# EAGLE design ECU full (EAGLE 9.6.2)
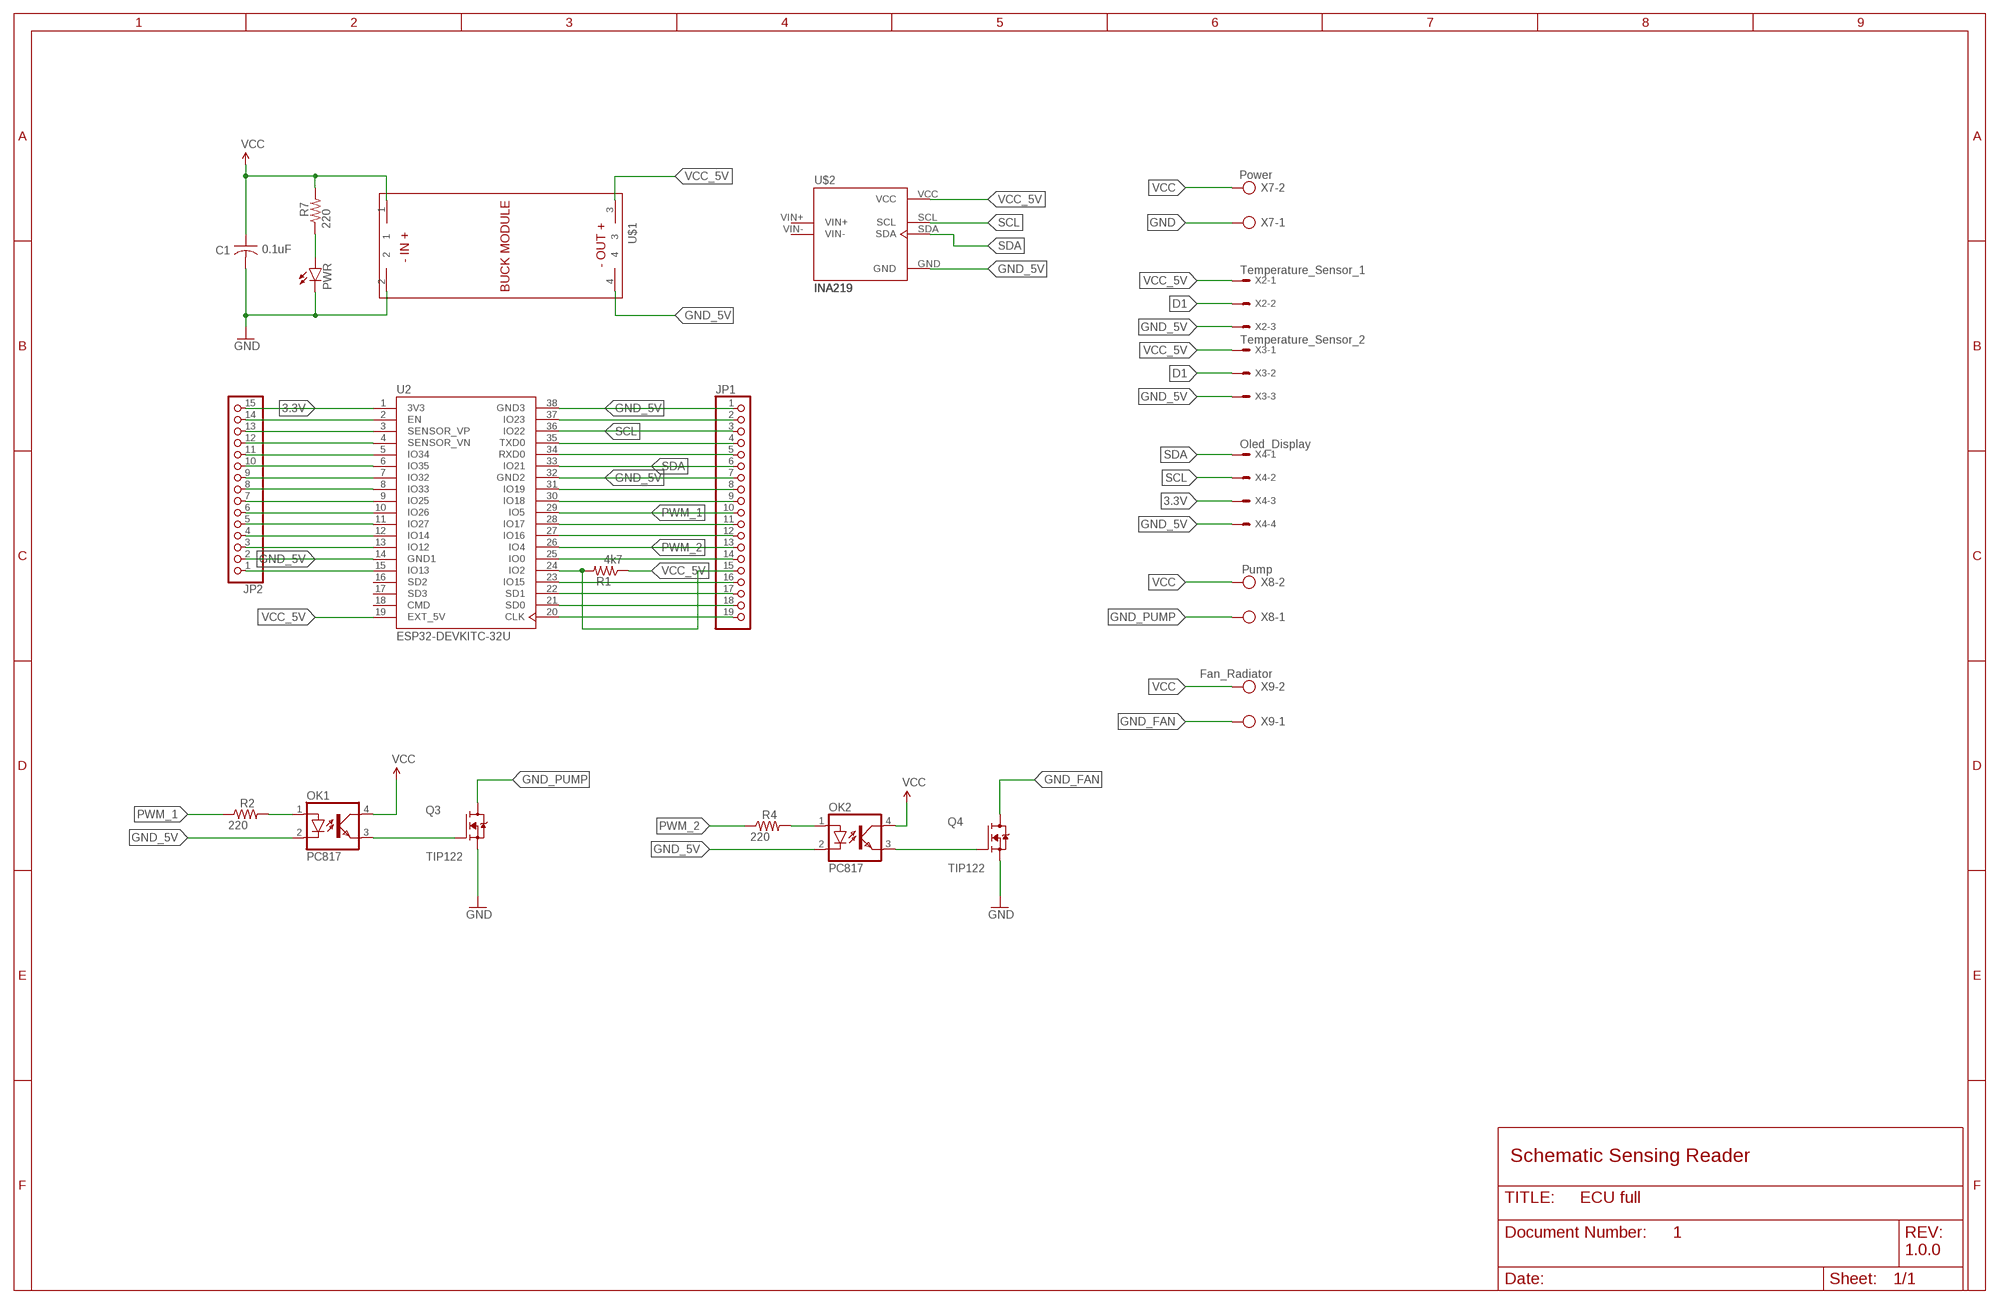
[diagram p0: schematic, sheet 1]
FRAME1 (FRAME_B_L): DESIGNER: PRATIK MAKWANA; DOC: 1; REV: 1.0.0

## Parts
C1  0.1uF  C-US050-030X075  [C050-030X075]
JP1  PINHD-1X19  [1X19]
JP2  PINHD-1X15  [1X15]
OK1  PC817  [DIL04]
OK2  PC817  [DIL04]
PWR  LED5MM  [LED5MM]
Q3  TIP122  IRF3205  [TO254P1041X444X2933-3]
Q4  TIP122  IRF3205  [TO254P1041X444X2933-3]
R1  4k7  R-US_0207/10  [0207/10]
R2  220  R-US_0207/10  [0207/10]
R4  220  R-US_0207/10  [0207/10]
R7  220  R-US_0207/10  [0207/10]
U2  ESP32-DEVKITC-32U  [MODULE_ESP32-DEVKITC-32U]
U$1  BUCK_MODULEWITH_SMDPADS&THROUGHHOLES  [BUCK_MODULE]
U$2  INA219  [INA219]
X2  Temperature_Sensor_1  22-23-2031  [22-23-2031]
X3  Temperature_Sensor_2  22-23-2031  [22-23-2031]
X4  Oled_Display  22-23-2041  [22-23-2041]
X7  Power  AK500/2  [AK500/2]
X8  Pump  AK500/2  [AK500/2]
X9  Fan_Radiator  AK500/2  [AK500/2]

## Nets
3.3V: JP2.15 U2.1(3V3) X4.3
D1: JP1.15 R1.2 U2.24(IO2) X2.2 X3.2
GND: C1.2 PWR.K(C) Q3.3(S) Q4.3(S) U$1.2 X7.1
GND_5V: JP1.1 JP1.7 JP2.2 OK1.2(C) OK2.2(C) U2.14(GND1) U2.32(GND2) U2.38(GND3) U$1.4 U$2.GND X2.3 X3.3 X4.4
GND_FAN: Q4.2(D) X9.1
GND_PUMP: Q3.2(D) X8.1
N$1: OK1.1(A) R2.2
N$2: JP2.14 U2.2(EN)
N$3: JP2.13 U2.3(SENSOR_VP)
N$4: JP2.12 U2.4(SENSOR_VN)
N$5: JP2.11 U2.5(IO34)
N$6: JP2.10 U2.6(IO35)
N$7: JP2.9 U2.7(IO32)
N$8: JP2.8 U2.8(IO33)
N$9: JP2.7 U2.9(IO25)
N$10: JP2.6 U2.10(IO26)
N$11: JP2.5 U2.11(IO27)
N$12: JP2.4 U2.12(IO14)
N$13: JP2.3 U2.13(IO12)
N$14: JP2.1 U2.15(IO13)
N$15: OK1.3(EMIT) Q3.1(G)
N$16: OK2.1(A) R4.2
N$17: OK2.3(EMIT) Q4.1(G)
N$18: JP1.19 U2.20(CLK)
N$19: JP1.18 U2.21(SD0)
N$20: JP1.17 U2.22(SD1)
N$21: JP1.14 U2.25(IO0)
N$22: JP1.16 U2.23(IO15)
N$23: JP1.12 U2.27(IO16)
N$24: JP1.11 U2.28(IO17)
N$25: JP1.9 U2.30(IO18)
N$26: JP1.2 U2.37(IO23)
N$27: JP1.4 U2.35(TXD0)
N$28: JP1.5 U2.34(RXD0)
N$29: JP1.8 U2.31(IO19)
N$30: PWR.A R7.1
PWM_1: JP1.10 R2.1 U2.29(IO5)
PWM_2: JP1.13 R4.1 U2.26(IO4)
SCL: JP1.3 U2.36(IO22) U$2.SCL X4.2
SDA: JP1.6 U2.33(IO21) U$2.SDA X4.1
VCC: C1.1 OK1.4(COL) OK2.4(COL) R7.2 U$1.1 X7.2 X8.2 X9.2
VCC_5V: R1.1 U2.19(EXT_5V) U$1.3 U$2.VCC X2.1 X3.1
Unconnected: U2.16(SD2) U2.17(SD3) U2.18(CMD) U$2.VIN+ U$2.VIN-

## Notes on the sheet
- Schematic Sensing Reader

## Library data of the parts
C1 = adafruit:C-US: CAPACITOR, American symbol
JP1 = pinhead:PINHD-1X19: PIN HEADER
JP2 = pinhead:PINHD-1X15: PIN HEADER
OK1 OK2 = optocoupler:PC817: SHARP OPTO COUPLER; MPN: PC817X4J000F; OC_FARNELL: 9707727; OC_NEWARK: 97K7059
PWR = led:LED: LED OSRAM: - CHIPLED LG R971, LG N971, LY N971, LG Q971, LY Q971, LO R971, LY R971 LH N974, LH R974 LS Q976, LO Q976, LY Q976 LO Q996 - Hyper CHIPLED LW Q18S LB Q993, LB Q99A, LB R99A - SideLED LS A670, LO A670, LY A670, LG A670, LP A670 LB A673, LV A673, LT A673, LW A673 LH A674 LY A675 LS A676, LA A676, LO A676, LY A676, LW A676 LS A679, LY A679, LG A679 - Hyper Micro SIDELED® LS Y876, LA Y876, LO Y876, LY Y876 LT Y87S - SmartLED LW L88C, LW L88S LB L89C, LB L89S, LG L890 LS L89K, LO L89K, LY L89K LS L896, LA L896, LO L896, LY L896 - TOPLED LS T670, LO T670, LY T670, LG T670, LP T670 LSG T670, LSP T670, LSY T670, LOP T670, LYG T670 LG T671, LOG T671, LSG T671 LB T673, LV T673, LT T673, LW T673 LH T674 LS T676, LA T676, LO T676, LY T676, LB T676, LH T676, LSB T676, LW T676 LB T67C, LV T67C, LT T67C, LS T67K, LO T67K, LY T67K, LW E67C LS E67B, LA E67B, LO E67B, LY E67B, LB E67C, LV E67C, LT E67C LW T67C LS T679, LY T679, LG T679 LS T770, LO T770, LY T770, LG T770, LP T770 LB T773, LV T773, LT T773, LW T773 LH T774 LS E675, LA E675, LY E675, LS T675 LS T776, LA T776, LO T776, LY T776, LB T776 LHGB T686 LT T68C, LB T68C - Hyper Mini TOPLED® LB M676 - Mini TOPLED Santana® LG M470 LS M47K, LO M47K, LY M47K Source: http://www.osram.convergy.de LUXEON: - LUMILED® LXK2-PW12-R00, LXK2-PW12-S00, LXK2-PW14-U00, LXK2-PW14-V00 LXK2-PM12-R00, LXK2-PM12-S00, LXK2-PM14-U00 LXK2-PE12-Q00, LXK2-PE12-R00, LXK2-PE12-S00, LXK2-PE14-T00, LXK2-PE14-U00 LXK2-PB12-K00, LXK2-PB12-L00, LXK2-PB12-M00, LXK2-PB14-N00, LXK2-PB14-P00, LXK2-PB14-Q00 LXK2-PR12-L00, LXK2-PR12-M00, LXK2-PR14-Q00, LXK2-PR14-R00 LXK2-PD12-Q00, LXK2-PD12-R00, LXK2-PD12-S00 LXK2-PH12-R00, LXK2-PH12-S00 LXK2-PL12-P00, LXK2-PL12-Q00, LXK2-PL12-R00 Source: www.luxeon.com KINGBRIGHT: KA-3528ASYC Source: www.kingbright.com
Q3 Q4 = IRF3205:IRF3205: N-Channel 55V 75A (Tc) 170W (Tc) Through Hole TO-220AB Check availability <https://pricing.snapeda.com/parts/IRF3205/Infineon%20Technologies/view-part?ref=eda>; AVAILABILITY: In Stock; CHECK_PRICES: https://www.snapeda.com/parts/IRF3205/Infineon/view-part/?ref=eda; DESCRIPTION: N-Channel 55V 110A (Tc) 200W (Tc) Through Hole TO-220AB; MF: Infineon Technologies; MP: IRF3205; PACKAGE: TO-220 Infineon; PRICE: None; SNAPEDA_LINK: https://www.snapeda.com/parts/IRF3205/Infineon/view-part/?ref=snap
R1 R2 R4 R7 = adafruit:R-US_: RESISTOR, American symbol
U2 = ESP32-DEVKITC-32U:ESP32-DEVKITC-32U: Check availability <https://pricing.snapeda.com/parts/ESP32-DEVKITC-32U/Espressif%20Systems/view-part?ref=eda>; AVAILABILITY: In Stock; CHECK_PRICES: https://www.snapeda.com/parts/ESP32-DEVKITC-32U/Espressif+Systems/view-part/?ref=eda; DESCRIPTION: ESP32-WROOM-32UE series Transceiver; 802.11 b/g/n (Wi-Fi, WiFi, WLAN), Bluetooth® Smart Ready 4.x Dual Mode Evaluation Board; MF: Espressif Systems; MP: ESP32-DEVKITC-32U; PACKAGE: CUSTOM-38 ESPRESSIF; PRICE: None; SNAPEDA_LINK: https://www.snapeda.com/parts/ESP32-DEVKITC-32U/Espressif+Systems/view-part/?ref=snap
U$1 = BUCK_MODULE:BUCK_MODULE
U$2 = INA219:INA219
X2 X3 = con-molex:22-23-2031: .100" (2.54mm) Center Header - 3 Pin; MF: MOLEX; MPN: 22-23-2031; OC_FARNELL: 1462950; OC_NEWARK: 30C0862
X4 = con-molex:22-23-2041: .100" (2.54mm) Center Header - 4 Pin; MF: MOLEX; MPN: 22-23-2041; OC_FARNELL: 1462920; OC_NEWARK: 38C0355
X7-X9 = con-ptr500:AK500/2: CONNECTOR; OC_FARNELL: unknown; OC_NEWARK: unknown

## Board
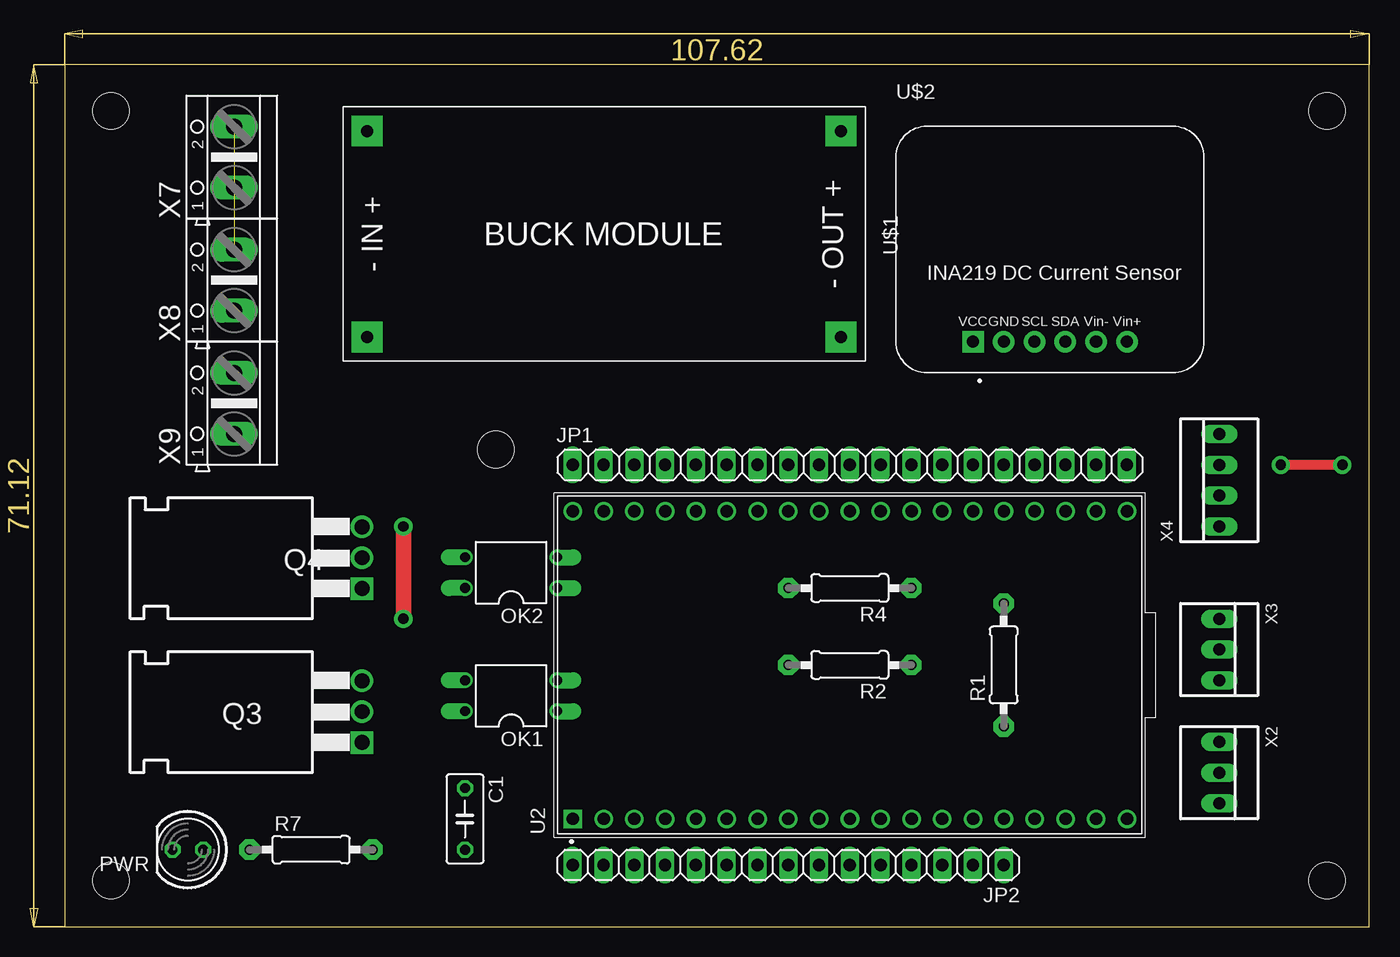
[diagram p1: board, top side]
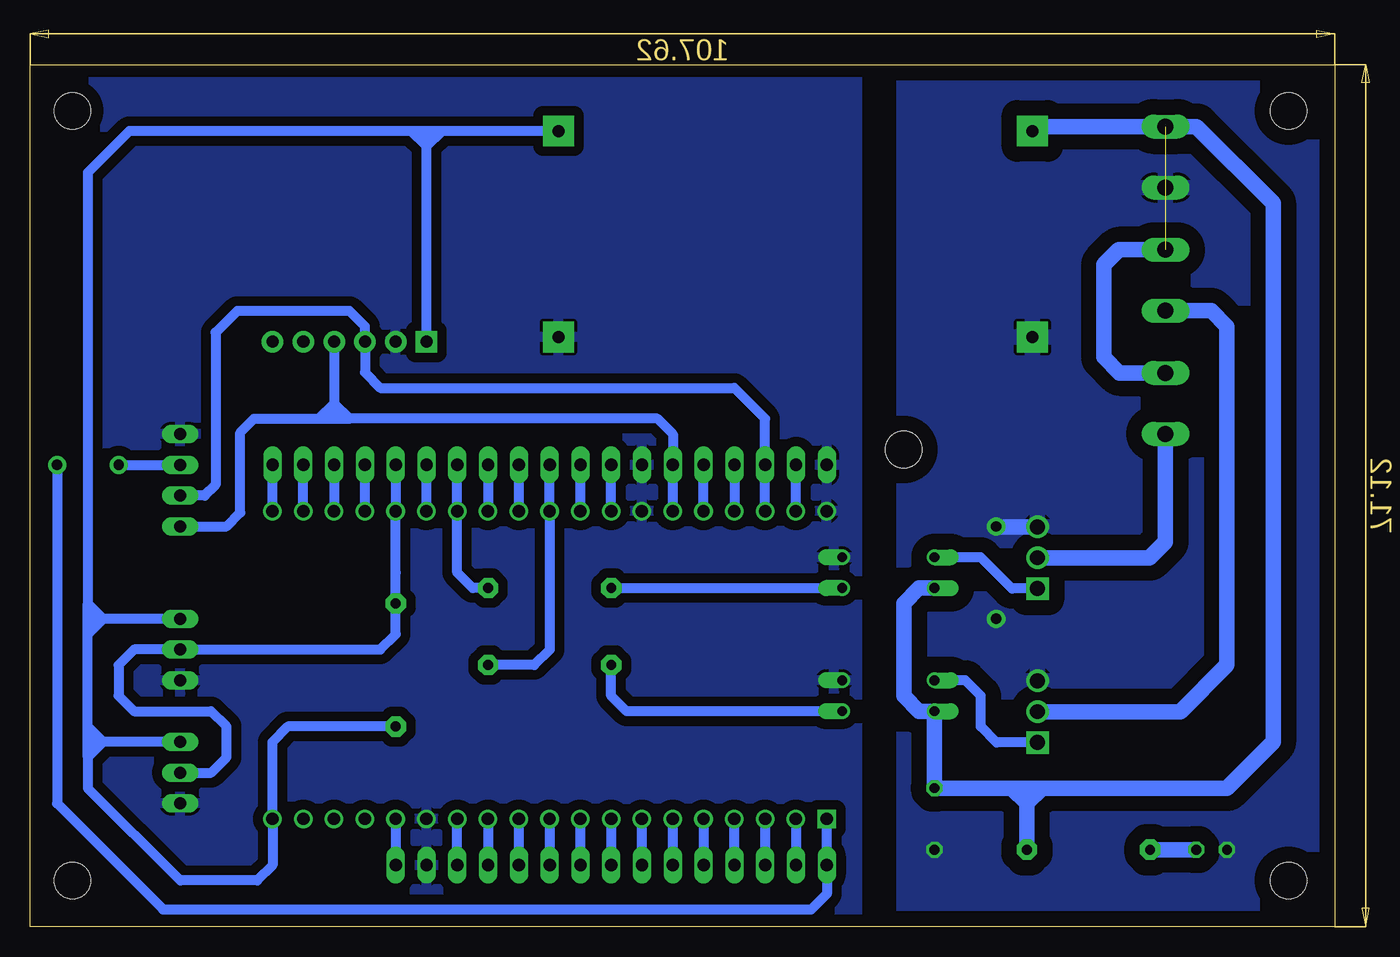
[diagram p2: board, bottom side, seen from below]

Size 107.62 x 71.11 mm. Coordinates in mm from the lower left corner, seen from the top.
Outline: 0,0 107.62,0 107.62,71.11 0,71.11 0,0
Copper layers (1*16): Top 0.035mm / dielectric 1.5mm / Bottom 0.035mm
Design rules "default": minimum track width 6mil, minimum drill 0.35mm, track to track 6mil, track to pad 6mil, pad to pad 6mil, via to via 6mil, smd to smd 6mil, copper to edge 40mil, drill to drill 6mil, minimum pad ring 10mil, minimum via ring 8mil, stop-mask expansion 4mil, vias tented up to drill 0mil, thermal gap 10mil
Holes 3 mm at 104.14,3.81 3.81,67.31 3.81,3.81 104.14,67.31 35.56,39.37

### Footprints (pad centres in the part's own frame; a part is rotated, then mirrored left to right if it is on the bottom)
C050-030X075 = drill 0.813 octagon: 1 -2.54,0; 2 2.54,0
1X19 = drill 1.016 long: 1 -22.86,0; 2 -20.32,0; 3 -17.78,0; 4 -15.24,0; 5 -12.7,0; 6 -10.16,0; 7 -7.62,0; 8 -5.08,0; 9 -2.54,0; 10 0,0; 11 2.54,0; 12 5.08,0; 13 7.62,0; 14 10.16,0; 15 12.7,0; 16 15.24,0; 17 17.78,0; 18 20.32,0; 19 22.86,0
1X15 = drill 1.016 long: 1 -17.78,0; 2 -15.24,0; 3 -12.7,0; 4 -10.16,0; 5 -7.62,0; 6 -5.08,0; 7 -2.54,0; 8 0,0; 9 2.54,0; 10 5.08,0; 11 7.62,0; 12 10.16,0; 13 12.7,0; 14 15.24,0; 15 17.78,0
DIL04 = drill 0.813 offset: 1 -1.27,-3.81; 2 1.27,-3.81; 3 1.27,3.81; 4 -1.27,3.81
LED5MM = drill 0.813 octagon: A -1.27,0; K 1.27,0
TO254P1041X444X2933-3 = drill 1.23 pad 1.85 square: 1 2.5,-4.2 | drill 1.23 pad 1.85: 2 5.04,-4.2; 3 7.58,-4.2
0207/10 = drill 0.813 pad 1.676 octagon: 1 -5.08,0; 2 5.08,0
MODULE_ESP32-DEVKITC-32U = drill 1.02 square: 1 -12.7,22.85 | drill 1.02: 2 -12.7,20.31; 3 -12.7,17.77; 4 -12.7,15.23; 5 -12.7,12.69; 6 -12.7,10.15; 7 -12.7,7.61; 8 -12.7,5.07; 9 -12.7,2.53; 10 -12.7,-0.01; 11 -12.7,-2.55; 12 -12.7,-5.09; 13 -12.7,-7.63; 14 -12.7,-10.17; 15 -12.7,-12.71; 16 -12.7,-15.25; 17 -12.7,-17.79; 18 -12.7,-20.33; 19 -12.7,-22.87; 20 12.7,-22.87; 21 12.7,-20.33; 22 12.7,-17.79; 23 12.7,-15.25; 24 12.7,-12.71; 25 12.7,-10.17; 26 12.7,-7.63; 27 12.7,-5.09; 28 12.7,-2.55; 29 12.7,-0.01; 30 12.7,2.53; 31 12.7,5.07; 32 12.7,7.61; 33 12.7,10.15; 34 12.7,12.69; 35 12.7,15.23; 36 12.7,17.77; 37 12.7,20.31; 38 12.7,22.85
BUCK_MODULE = drill 1 pad 2.54 square: 1 -8.5,-19.5; 2 8.5,-19.5; 3 -8.5,19.6; 4 8.5,19.6
INA219 = drill 1 pad 1.778: GND 8.89,2.54; SCL 11.43,2.54; SDA 13.97,2.54; VIN+ 19.05,2.54; VIN- 16.51,2.54 | drill 1 pad 1.778 square: VCC 6.35,2.54
22-23-2031 = drill 1 long: 1 -2.54,0; 2 0,0; 3 2.54,0
22-23-2041 = drill 1 long: 1 -3.81,0; 2 -1.27,0; 3 1.27,0; 4 3.81,0
AK500/2 = drill 1.321 long: 1 -2.515,0; 2 2.515,0

### Placement (x,y rotation side)
C1  33.02,8.89 270 top
JP1  64.77,38.1 0 top
JP2  59.69,5.08 180 top
OK1  36.83,19.05 90 top
OK2  36.83,29.21 90 top
PWR  10.16,6.35 180 top
Q3  20.32,12.7 90 top
Q4  20.32,25.4 90 top
R1  77.47,21.59 90 top
R2  64.77,21.59 180 top
R4  64.77,27.94 180 top
R7  20.32,6.35 0 top
U2  64.77,21.59 90 top
U$1  44.45,57.15 270 top
U$2  68.58,45.72 0 top
X2  95.25,12.7 270 top
X3  95.25,22.86 270 top
X4  95.25,36.83 90 top
X7  13.97,63.5 90 top
X8  13.97,53.34 90 top
X9  13.97,43.18 90 top

### Tracks (layer width: path | path; a pad name or v marks a point on that pad's centre or on a via)
3.3V  (via drill 0.85 pad 1.5)
  Top 0.813: v105.41,38.1 v100.33,38.1
  Bottom 0.813: U2.1 JP2.15 41.91,2.69 43.18,1.42 96.67,1.42 105.41,10.16 v105.41,38.1 | v100.33,38.1 X4.3
D1
  Bottom 0.813: JP1.15 U2.24 R1.2 | R1.2 77.47,29.21 | X2.2 92.71,12.7 91.44,13.97 91.44,16.51 92.71,17.78 99.06,17.78 100.33,19.05 100.33,21.59 99.06,22.86 X3.2 78.74,22.86 77.47,24.13 R1.2
GND  (via drill 0.85 pad 1.5)
  Top 1.27: v27.94,33.02 v27.94,25.4
  Bottom 1.27: Q4.3 27.9,32.98 v27.94,33.02
  pour Bottom (isolate 1.27): 0,71.12 35.56,71.12 35.56,0 0,0
GND_5V
  pour Bottom (isolate 0.813): 107.95,71.12 107.95,0 39.37,0 39.37,71.12
GND_FAN
  Bottom 1.27: X9.1 13.97,31.75 15.28,30.44 Q4.2
GND_PUMP
  Bottom 1.27: X8.1 10.19,50.83 8.89,49.53 8.89,21.59 12.74,17.74 Q3.2
N$1
  Bottom 0.813: OK1.1 58.42,17.78 59.69,19.05 R2.2
N$2
  Bottom 0.813: U2.2 JP2.14
N$3
  Bottom 0.813: U2.3 JP2.13
N$4
  Bottom 0.813: JP2.12 U2.4
N$5
  Bottom 0.813: U2.5 JP2.11
N$6
  Bottom 0.813: JP2.10 U2.6
N$7
  Bottom 0.813: JP2.9 U2.7
N$8
  Bottom 0.813: U2.8 JP2.8
N$9
  Bottom 0.813: JP2.7 U2.9
N$10
  Bottom 0.813: U2.10 JP2.6
N$11
  Bottom 0.813: JP2.5 U2.11
N$12
  Bottom 0.813: U2.12 JP2.4
N$13
  Bottom 0.813: JP2.3 U2.13
N$14
  Bottom 0.813: U2.15 JP2.1
N$15
  Bottom 0.813: Q3.1 27.9,15.2 29.21,16.51 29.21,19.05 30.48,20.32 OK1.3
N$16
  Bottom 0.813: R4.2 OK2.1
N$17
  Bottom 0.813: Q4.1 26.63,27.9 29.21,30.48 OK2.3
N$18
  Bottom 0.813: U2.20 JP1.19
N$19
  Bottom 0.813: U2.21 JP1.18
N$20
  Bottom 0.813: JP1.17 U2.22
N$21
  Bottom 0.813: U2.25 JP1.14
N$22
  Bottom 0.813: U2.23 JP1.16
N$23
  Bottom 0.813: JP1.12 U2.27
N$24
  Bottom 0.813: U2.28 JP1.11
N$25
  Bottom 0.813: U2.30 JP1.9
N$26
  Bottom 0.813: U2.37 JP1.2
N$27
  Bottom 0.813: JP1.4 U2.35
N$28
  Bottom 0.813: U2.34 JP1.5
N$29
  Bottom 0.813: U2.31 JP1.8
N$30
  Bottom 1.27: PWR.A R7.1
PWM_1
  Bottom 0.813: JP1.10 U2.29 64.78,22.85 66.04,21.59 R2.1
PWM_2
  Bottom 0.813: JP1.13 U2.26 72.4,29.22 71.12,27.94 R4.1
SCL
  Bottom 0.813: U2.36 JP1.3 46.99,41.91 49.53,44.45 78.74,44.45 80.01,45.72 U$2.SCL 80.01,49.53 81.28,50.8 90.55,50.8 92.33,49.02 92.33,36.45 93.22,35.56 X4.2
SDA
  Bottom 0.813: U2.33 JP1.6 54.61,40.64 55.88,41.91 81.28,41.91 | 81.28,41.91 82.55,43.18 | U$2.SDA 82.55,43.18 | X4.1 91.44,33.02 90.3,34.16 90.3,40.77 89.15,41.91 83.82,41.91 | 83.82,41.91 82.55,41.91 | 82.55,41.91 81.28,41.91 | 82.55,43.18 83.82,41.91 | 82.55,43.18 82.55,41.91
VCC  (1 unrouted)
  Bottom 1.27: OK2.4 34.29,27.94 35.56,26.67 35.56,19.05 34.29,17.78 OK1.4 C1.1 26.67,11.43 | X8.2 17.8,55.85 19.05,54.61 19.05,46.99 17.75,45.7 X9.2 | 13.95,66.04 X7.2 | X7.2 11.4,66.02 5.08,59.69 5.08,15.24 8.89,11.43 24.13,11.43 | 24.13,11.43 26.67,11.43 | R7.2 25.4,10.16 | 25.4,10.16 26.67,11.43 | 25.4,10.16 24.13,11.43 | X7.2 24.59,66.02 U$1.1
VCC_5V
  Bottom 0.813: R1.1 86.37,16.51 87.64,15.24 U2.19 87.64,5.07 88.9,3.81 95.25,3.81 102.87,11.43 102.87,13.97 | 102.87,16.51 102.87,24.13 | X2.1 101.6,15.24 | 102.87,16.51 101.6,15.24 | X3.1 101.6,25.4 | 102.87,24.13 101.6,25.4 | 102.87,24.13 102.87,25.4 | 102.87,25.4 102.87,26.67 | 101.6,25.4 102.87,26.67 | 101.6,25.4 102.87,25.4 | 74.93,65.65 73.66,65.65 74.93,64.38 | 74.93,65.65 76.2,65.65 | 76.2,65.65 99.45,65.65 102.87,62.23 102.87,26.67 | U$2.VCC 74.93,64.38 | 74.93,64.38 74.93,64.77 | 74.93,64.77 74.93,65.65 | 74.93,64.38 76.2,65.65 | 102.87,13.97 102.87,15.24 | 102.87,15.24 102.87,16.51 | 101.6,15.24 102.87,13.97 | 101.6,15.24 102.87,15.24 | U$1.3 74.05,65.65 74.93,64.77